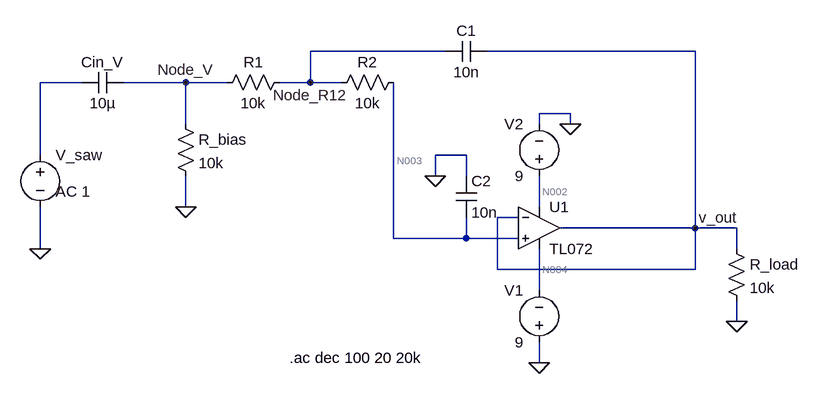
[diagram p0: schematic string.asc]
* string.asc
* U1: TL072 (symbol TL072 not available, pins judged from their places): In+=N003 In-=v_out V+=N002 V-=N004 OUT=v_out
V_saw N001 0 AC 1
Cin_V Node_V N001 10µ
R_bias Node_V 0 10k
R1 Node_R12 Node_V 10k
R2 N003 Node_R12 10k
C1 v_out Node_R12 10n
C2 0 N003 10n
R_load v_out 0 10k
V1 0 N004 9
V2 N002 0 9
.ac dec 100 20 20k
.backanno
.end

* Results of the author's LTspice run, read from the files saved beside the schematic
* Operating Point, zero values left out:
*   V(n002) = 9 V
*   V(n003) = -1.172 µV
*   V(n004) = -9 V
*   V(node_r12) = -781.1 nV
*   V(node_v) = -390.5 nV
*   V(v_out) = 9.799 µV
*   I(R1) = -39.05 pA
*   I(R2) = -39.05 pA
*   I(R_bias) = -39.05 pA
*   I(R_load) = 979.9 pA
*   I(V1) = -8.595 mA
*   I(V2) = -8.594 mA
*   Ix(u1:1) = 39.05 pA
*   Ix(u1:2) = 39.05 pA
*   Ix(u1:3) = 8.594 mA
*   Ix(u1:4) = -8.595 mA
*   Ix(u1:5) = -1.019 nA
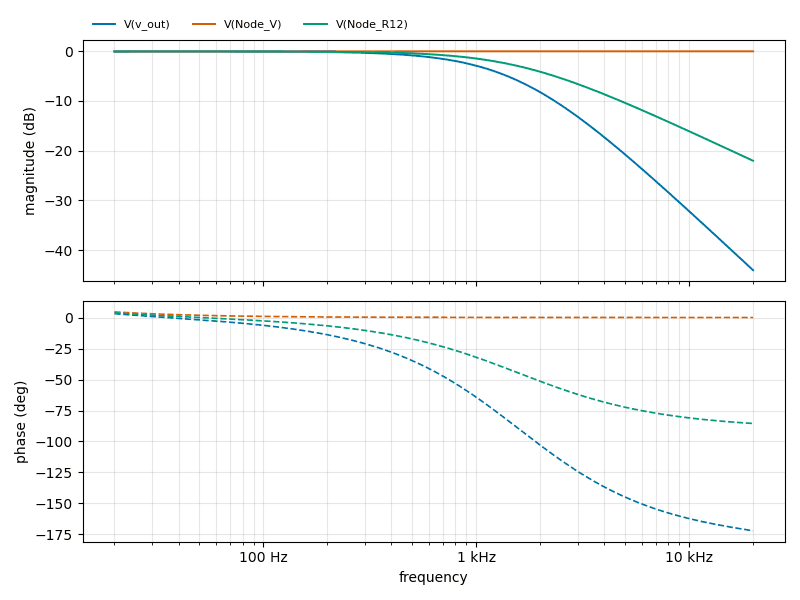
[diagram p1: AC Analysis of string.asc, plotted from the saved traces]
* AC Analysis, 1 run:
*   V(v_out): -0.04 dB at 20 Hz, -44.04 dB at 20 kHz, peak -0.02 dB at 42.76 Hz, 3 dB below the peak at 1.027 kHz
*   V(Node_V): -0.04 dB at 20 Hz, -0.00 dB at 20 kHz, peak -0.00 dB at 20 kHz
*   V(Node_R12): -0.04 dB at 20 Hz, -22.03 dB at 20 kHz, peak -0.02 dB at 50.24 Hz, 3 dB below the peak at 1.596 kHz